# Altium schematic sheet sekonder.SchDoc
size A4
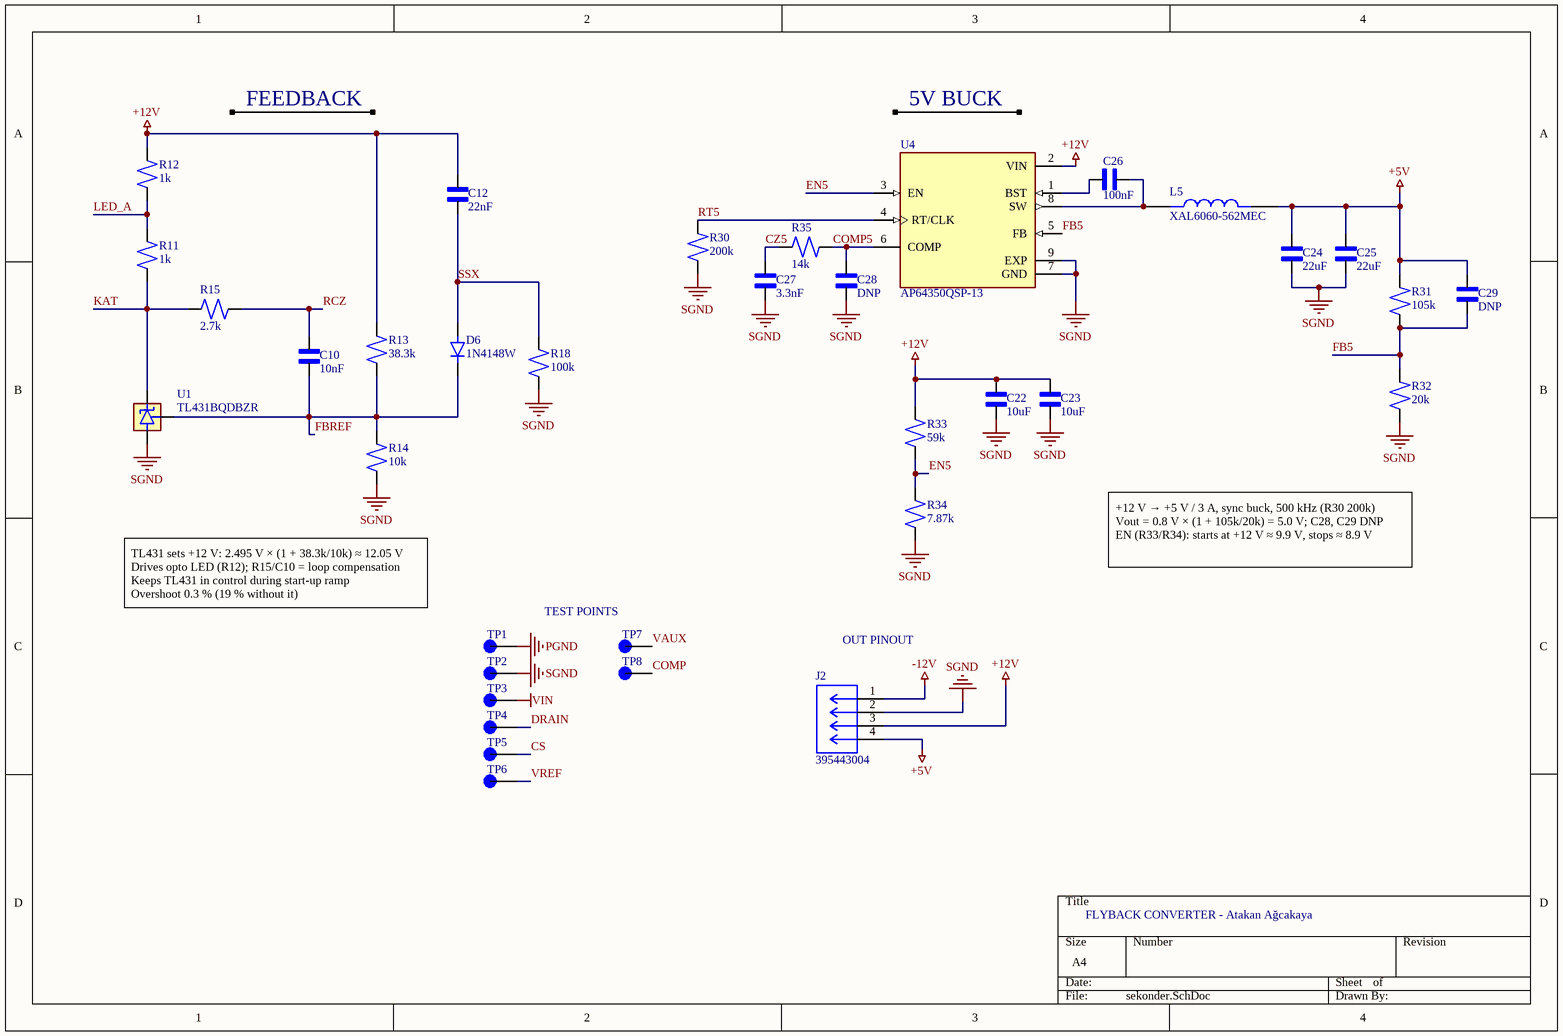
[diagram p0: sekonder.SchDoc]

## Parts
C10  10nF  [CAPC2012X145N]
C12  22nF  [CAPC2012X145N]
C22  10uF  [CAPC3225X280N]
C23  10uF  [CAPC3225X280N]
C24  22uF  [CAPC3225X280N]
C25  22uF  [CAPC3225X280N]
C26  100nF  [CAPC2012X145N]
C27  3.3nF  [CAPC2012X145N]
C28  DNP  [CAPC2012X145N]
C29  DNP  [CAPC2012X145N]
D6  1N4148W  [SODFL3816X120N]
J2  395443004  [CONN_SD-39544-001_NONE_04P_MOL]
L5  XAL6060-562MEC  [IND_XAL6060-562MEC]
R11  1k  [RESC2012X60N]
R12  1k  [RESC2012X60N]
R13  38.3k  [RESC2012X60N]
R14  10k  [RESC2012X60N]
R15  2.7k  [RESC2012X60N]
R18  100k  [RESC2012X60N]
R30  200k  [RESC2012X60N]
R31  105k  [RESC2012X60N]
R32  20k  [RESC2012X60N]
R33  59k  [RESC2012X60N]
R34  7.87k  [RESC2012X60N]
R35  14k  [RESC2012X60N]
TP1  5001  [KEYSTONE_5001]  (value not drawn)
TP2  5001  [KEYSTONE_5001]  (value not drawn)
TP3  5001  [KEYSTONE_5001]  (value not drawn)
TP4  5001  [KEYSTONE_5001]  (value not drawn)
TP5  5001  [KEYSTONE_5001]  (value not drawn)
TP6  5001  [KEYSTONE_5001]  (value not drawn)
TP7  5001  [KEYSTONE_5001]  (value not drawn)
TP8  5001  [KEYSTONE_5001]  (value not drawn)
U1  TL431BQDBZR  [SOT95P237X112-3N]
U4  AP64350QSP-13  [IC_AP64350QSP-13]

## Nets
+5V: C24.2 C25.2 C29.2 J2.4 L5.2 R31.2
+12V: C12.2 C22.2 C23.2 J2.3 R12.2 R13.2 R33.2 U4.2(VIN)
-12V: J2.1
PGND: TP1.TP
SGND: C22.1 C23.1 C24.1 C25.1 C27.1 C28.1 J2.2 R14.1 R18.1 R30.1 R32.2 R34.1 TP2.TP U1.3(ANODE) U4.7(GND) U4.9(EXP)
VIN: TP3.TP
COMP: TP8.TP
COMP5: C28.2 R35.1 U4.6(COMP)
CS: TP5.TP
CZ5: C27.2 R35.2
DRAIN: TP4.TP
EN5: R33.1 R34.2 U4.3(EN)
FB5: C29.1 R31.1 R32.1 U4.5(FB)
FBREF: C10.1 D6.C(K) R13.1 R14.2 U1.2(REF)
KAT: R11.1 R15.2 U1.1(CATHODE)
LED_A: R11.2 R12.1
RCZ: C10.2 R15.1
RT5: R30.2 U4.4(RT/CLK)
SSX: C12.1 D6.A R18.2
VAUX: TP7.TP
VREF: TP6.TP
NetC26_1: C26.1 U4.1(BST)
NetC26_2: C26.2 L5.1 U4.8(SW)

## Notes on the sheet
- FEEDBACK
- 5V BUCK
- +12 V → +5 V / 3 A, sync buck, 500 kHz (R30 200k)
  Vout = 0.8 V × (1 + 105k/20k) = 5.0 V; C28, C29 DNP
  EN (R33/R34): starts at +12 V ≈ 9.9 V, stops ≈ 8.9 V
- TL431 sets +12 V: 2.495 V × (1 + 38.3k/10k) ≈ 12.05 V
  Drives opto LED (R12); R15/C10 = loop compensation
  Keeps TL431 in control during start-up ramp
  Overshoot 0.3 % (19 % without it)
- (near TP7) TEST POINTS
- (near J2) OUT PINOUT
- FLYBACK CONVERTER - Atakan Ağcakaya

## Library data of the parts
C10 C12 C26-C29 = C_0805
  C10: Value: 10nF
  C12: Value: 22nF
  C26: Value: 100nF
  C27: Value: 3.3nF
  C28 C29: Value: DNP
C22-C25 = C_1210
  C22 C23: Value: 10uF
  C24 C25: Value: 22uF
D6 = 1N4148W: Small Signal Diode, SOD-123F, 100V, 0.15A, 150Â°C; MF: Diotec Semiconductor; SnapEDA_Link: https://www.snapeda.com/parts/1N4148W/Diotec/view-part/?ref=snap; Package: SOD-123F Diotec; Value: *; MP: 1N4148W; Check_prices: https://www.snapeda.com/parts/1N4148W/Diotec/view-part/?ref=eda
J2 = 395443004: Conn Eurostyle Block 4 POS 5.08mm Solder ST Thru-Hole 15A/Contact Eurostyleâ„¢; MF: Molex; SnapEDA_Link: https://www.snapeda.com/parts/395443004/Molex/view-part/?ref=snap; Package: None; Value: *; MP: 395443004; Check_prices: https://www.snapeda.com/parts/395443004/Molex/view-part/?ref=eda
L5 = XAL6060-562MEC: 5.6 ÂµH Shielded Molded Inductor 10 A 15.9mOhm Max Nonstandard; MF: Coilcraft; SnapEDA_Link: https://www.snapeda.com/parts/XAL6060-562MEC/Coilcraft/view-part/?ref=snap; Package: None; Value: *; MP: XAL6060-562MEC; Check_prices: https://www.snapeda.com/parts/XAL6060-562MEC/Coilcraft/view-part/?ref=eda
R11-R15 R18 R30-R35 = R_0805
  R11 R12: Value: 1k
  R13: Value: 38.3k
  R14: Value: 10k
  R15: Value: 2.7k
  R18: Value: 100k
  R30: Value: 200k
  R31: Value: 105k
  R32: Value: 20k
  R33: Value: 59k
  R34: Value: 7.87k
  R35: Value: 14k
TP1-TP8 = 5001: MF: Keystone Electronics; Package: None; Price: None; Value: *; MP: 5001; Availability: Unavailable
U4 = AP64350QSP-13: Buck Switching Regulator IC Positive Adjustable 0.8V 1 Output 3.5A 8-SOIC (0.154, 3.90mm Width) Exposed Pad; MF: Diodes Incorporated; MP: AP64350QSP13; SnapEDA_Link: https://www.snapeda.com/parts/AP64350QSP13/Diodes+Inc./view-part/?ref=snap; Package: None; Value: *; Check_prices: https://www.snapeda.com/parts/AP64350QSP13/Diodes+Inc./view-part/?ref=eda
U1 = TL431BQDBZR: Package: None; Price: None; Value: *; MP: TL431BQDBZR; Availability: Unavailable